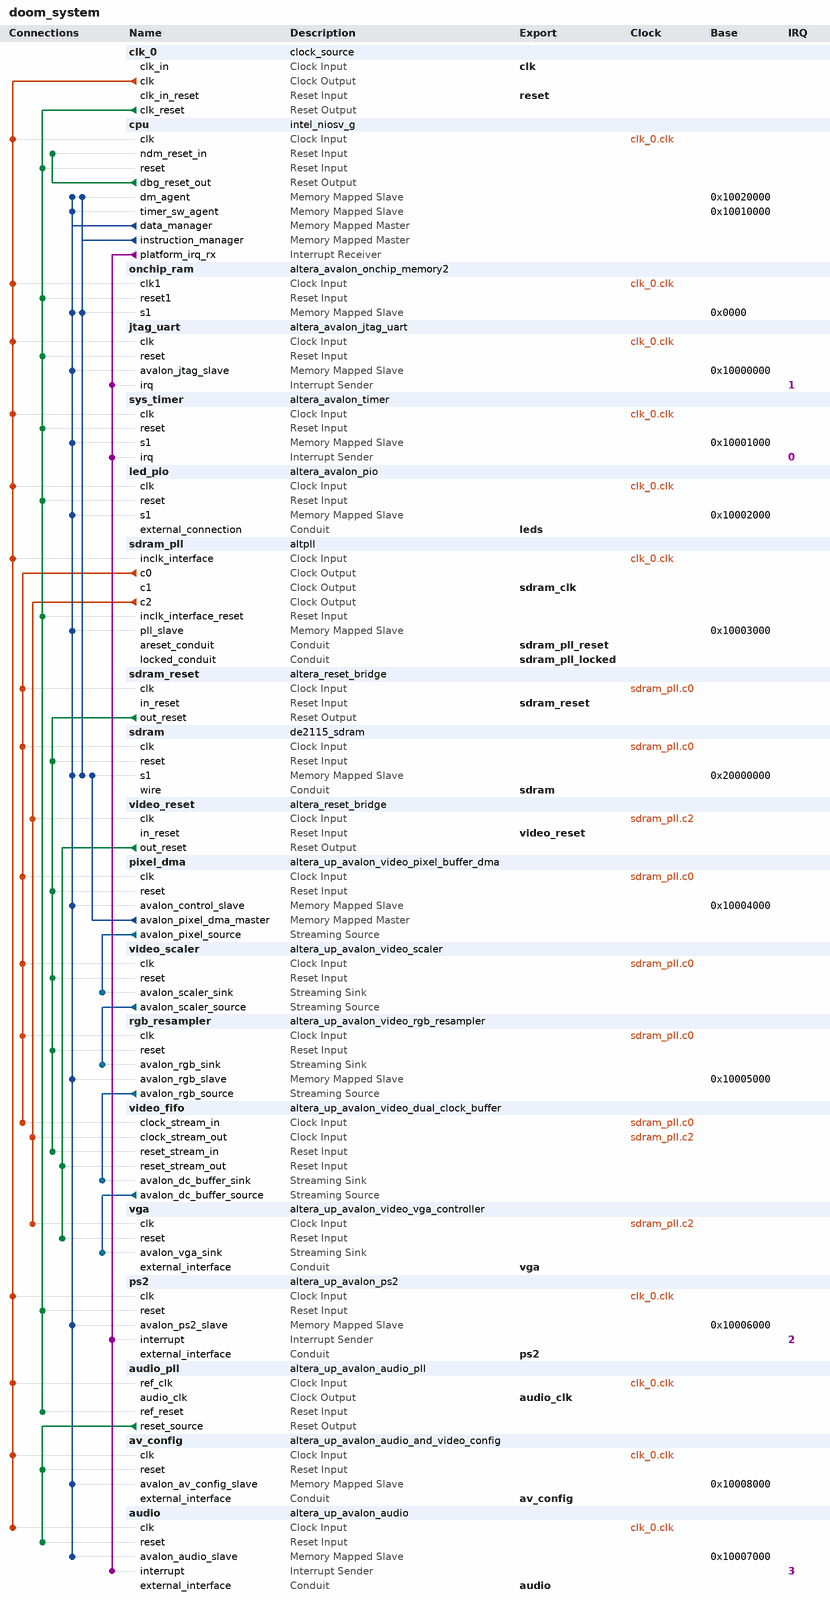
[diagram p0: system contents]
# Platform Designer (Qsys) system doom_system, Cyclone IV E EP4CE115F29C7
# Parameters at their usual value, and those the tool derives, are not listed.
package require -exact qsys 18.0
create_system doom_system
set_project_property DEVICE_FAMILY {Cyclone IV E}
set_project_property DEVICE EP4CE115F29C7

add_instance clk_0 clock_source 25.1
set_instance_parameter_value clk_0 clockFrequency 50000000

add_instance cpu intel_niosv_g 4.0.0
set_instance_parameter_value cpu Blind_Window_Period 1000
set_instance_parameter_value cpu CLICenabledInterruptMode 0
set_instance_parameter_value cpu CLICenabledShadowRegisterFiles 1
set_instance_parameter_value cpu Default_Timeout_Period 255
set_instance_parameter_value cpu alignCLICVectorTable 8
set_instance_parameter_value cpu basicInterruptMode 0
set_instance_parameter_value cpu basicShadowRegisterFiles 0
set_instance_parameter_value cpu clockFrequency 50000000
set_instance_parameter_value cpu dataCacheSize 16384
set_instance_parameter_value cpu disableFsqrtFdiv false
set_instance_parameter_value cpu dtcm1Base 0
set_instance_parameter_value cpu dtcm1Size 0
set_instance_parameter_value cpu dtcm2Base 0
set_instance_parameter_value cpu dtcm2Size 0
set_instance_parameter_value cpu enableBranchPrediction true
set_instance_parameter_value cpu enableCLICInterruptEdgeTriggerConfig false
set_instance_parameter_value cpu enableCLICInterruptPolarityConfig false
set_instance_parameter_value cpu enableCLICSelectiveHardwareVectoring false
set_instance_parameter_value cpu enableCoreLevelInterruptController false
set_instance_parameter_value cpu enableDebug true
set_instance_parameter_value cpu enableDebugReset true
set_instance_parameter_value cpu enableECCFull false
set_instance_parameter_value cpu enableECCLite false
set_instance_parameter_value cpu enableFPU false
set_instance_parameter_value cpu enableLockstep false
set_instance_parameter_value cpu enableLockstepExtRst false
set_instance_parameter_value cpu enableMulDiv true
set_instance_parameter_value cpu hartId 0
set_instance_parameter_value cpu instCacheSize 16384
set_instance_parameter_value cpu itcm1Base 0
set_instance_parameter_value cpu itcm1Size 0
set_instance_parameter_value cpu itcm2Base 0
set_instance_parameter_value cpu itcm2Size 0
set_instance_parameter_value cpu numCLICDebugTriggers 0
set_instance_parameter_value cpu numCLICLevels 2
set_instance_parameter_value cpu numCLICPlatformInterrupts 16
set_instance_parameter_value cpu numCLICPriorities 8
set_instance_parameter_value cpu peripheralRegionABase 268435456
set_instance_parameter_value cpu peripheralRegionASize 1048576
set_instance_parameter_value cpu peripheralRegionBBase 670040064
set_instance_parameter_value cpu peripheralRegionBSize 1048576
set_instance_parameter_value cpu resetOffset 0
set_instance_parameter_value cpu resetSlave onchip_ram.s1
set_instance_parameter_value cpu useResetReq false

add_instance onchip_ram altera_avalon_onchip_memory2 25.1
set_instance_parameter_value onchip_ram blockType M9K
set_instance_parameter_value onchip_ram dataWidth 32
set_instance_parameter_value onchip_ram dualPort false
set_instance_parameter_value onchip_ram initMemContent false
set_instance_parameter_value onchip_ram initializationFileName onchip_mem.hex
set_instance_parameter_value onchip_ram memorySize 65536

add_instance jtag_uart altera_avalon_jtag_uart 25.1
set_instance_parameter_value jtag_uart simInteractiveOptions NO_INTERACTIVE_WINDOWS

add_instance sys_timer altera_avalon_timer 25.1
set_instance_parameter_value sys_timer alwaysRun true
set_instance_parameter_value sys_timer fixedPeriod true
set_instance_parameter_value sys_timer period 1
set_instance_parameter_value sys_timer periodUnits MSEC

add_instance led_pio altera_avalon_pio 25.1
set_instance_parameter_value led_pio direction Output
set_instance_parameter_value led_pio width 8

add_instance sdram_pll altpll 25.1
set_instance_parameter_value sdram_pll CLK0_DIVIDE_BY 1
set_instance_parameter_value sdram_pll CLK0_MULTIPLY_BY 2
set_instance_parameter_value sdram_pll CLK1_DIVIDE_BY 1
set_instance_parameter_value sdram_pll CLK1_DUTY_CYCLE 50
set_instance_parameter_value sdram_pll CLK1_MULTIPLY_BY 2
set_instance_parameter_value sdram_pll CLK1_PHASE_SHIFT -1810
set_instance_parameter_value sdram_pll CLK2_DIVIDE_BY 2
set_instance_parameter_value sdram_pll CLK2_DUTY_CYCLE 50
set_instance_parameter_value sdram_pll CLK2_MULTIPLY_BY 1
set_instance_parameter_value sdram_pll CLK2_PHASE_SHIFT 0
set_instance_parameter_value sdram_pll INCLK0_INPUT_FREQUENCY 20000
set_instance_parameter_value sdram_pll PORT_ARESET PORT_USED
set_instance_parameter_value sdram_pll PORT_LOCKED PORT_USED
set_instance_parameter_value sdram_pll PORT_clk1 PORT_USED
set_instance_parameter_value sdram_pll PORT_clk2 PORT_USED
set_instance_parameter_value sdram_pll PORT_clk3 PORT_UNUSED

add_instance sdram_reset altera_reset_bridge 25.1
set_instance_parameter_value sdram_reset ACTIVE_LOW_RESET 1
set_instance_parameter_value sdram_reset SYNCHRONOUS_EDGES deassert

add_instance sdram de2115_sdram 1.0

add_instance video_reset altera_reset_bridge 25.1
set_instance_parameter_value video_reset ACTIVE_LOW_RESET 1
set_instance_parameter_value video_reset SYNCHRONOUS_EDGES deassert

add_instance pixel_dma altera_up_avalon_video_pixel_buffer_dma 18.0
set_instance_parameter_value pixel_dma addr_mode Consecutive
set_instance_parameter_value pixel_dma back_start_address 670302208
set_instance_parameter_value pixel_dma color_space {16-bit RGB}
set_instance_parameter_value pixel_dma image_height 240
set_instance_parameter_value pixel_dma image_width 320
set_instance_parameter_value pixel_dma start_address 670040064

add_instance video_scaler altera_up_avalon_video_scaler 18.0
set_instance_parameter_value video_scaler color_bits 16
set_instance_parameter_value video_scaler color_planes 1
set_instance_parameter_value video_scaler height_scaling 2
set_instance_parameter_value video_scaler width_in 320
set_instance_parameter_value video_scaler width_scaling 2

add_instance rgb_resampler altera_up_avalon_video_rgb_resampler 18.0
set_instance_parameter_value rgb_resampler alpha 1023
set_instance_parameter_value rgb_resampler input_type {16-bit RGB}
set_instance_parameter_value rgb_resampler output_type {30-bit RGB}

add_instance video_fifo altera_up_avalon_video_dual_clock_buffer 18.0
set_instance_parameter_value video_fifo color_bits 10

add_instance vga altera_up_avalon_video_vga_controller 18.0
set_instance_parameter_value vga board DE2-115
set_instance_parameter_value vga resolution {VGA 640x480}

add_instance ps2 altera_up_avalon_ps2 18.0

add_instance audio_pll altera_up_avalon_audio_pll 18.0
set_instance_parameter_value audio_pll gui_refclk 50.0

add_instance av_config altera_up_avalon_audio_and_video_config 18.0
set_instance_parameter_value av_config audio_in {Line In to ADC}
set_instance_parameter_value av_config bit_length 16
set_instance_parameter_value av_config board DE2-115
set_instance_parameter_value av_config line_in_bypass false
set_instance_parameter_value av_config sampling_rate {48 kHz}

add_instance audio altera_up_avalon_audio 18.0
set_instance_parameter_value audio audio_in false
set_instance_parameter_value audio avalon_bus_type {Memory Mapped}
set_instance_parameter_value audio dw 16

# connections
add_connection clk_0.clk audio.clk clock
add_connection clk_0.clk audio_pll.ref_clk clock
add_connection clk_0.clk av_config.clk clock
add_connection clk_0.clk cpu.clk clock
add_connection clk_0.clk jtag_uart.clk clock
add_connection clk_0.clk led_pio.clk clock
add_connection clk_0.clk onchip_ram.clk1 clock
add_connection clk_0.clk ps2.clk clock
add_connection clk_0.clk sdram_pll.inclk_interface clock
add_connection clk_0.clk sys_timer.clk clock
add_connection sdram_pll.c0 pixel_dma.clk clock
add_connection sdram_pll.c0 rgb_resampler.clk clock
add_connection sdram_pll.c0 sdram.clk clock
add_connection sdram_pll.c0 sdram_reset.clk clock
add_connection sdram_pll.c0 video_fifo.clock_stream_in clock
add_connection sdram_pll.c0 video_scaler.clk clock
add_connection sdram_pll.c2 vga.clk clock
add_connection sdram_pll.c2 video_fifo.clock_stream_out clock
add_connection sdram_pll.c2 video_reset.clk clock
add_connection audio_pll.reset_source audio.reset reset
add_connection audio_pll.reset_source av_config.reset reset
add_connection clk_0.clk_reset audio_pll.ref_reset reset
add_connection clk_0.clk_reset cpu.reset reset
add_connection clk_0.clk_reset jtag_uart.reset reset
add_connection clk_0.clk_reset led_pio.reset reset
add_connection clk_0.clk_reset onchip_ram.reset1 reset
add_connection clk_0.clk_reset ps2.reset reset
add_connection clk_0.clk_reset sdram_pll.inclk_interface_reset reset
add_connection clk_0.clk_reset sys_timer.reset reset
add_connection cpu.dbg_reset_out cpu.ndm_reset_in reset
add_connection sdram_reset.out_reset pixel_dma.reset reset
add_connection sdram_reset.out_reset rgb_resampler.reset reset
add_connection sdram_reset.out_reset sdram.reset reset
add_connection sdram_reset.out_reset video_fifo.reset_stream_in reset
add_connection sdram_reset.out_reset video_scaler.reset reset
add_connection video_reset.out_reset vga.reset reset
add_connection video_reset.out_reset video_fifo.reset_stream_out reset
add_connection cpu.data_manager audio.avalon_audio_slave avalon
set_connection_parameter_value cpu.data_manager/audio.avalon_audio_slave baseAddress 0x10007000
add_connection cpu.data_manager av_config.avalon_av_config_slave avalon
set_connection_parameter_value cpu.data_manager/av_config.avalon_av_config_slave baseAddress 0x10008000
add_connection cpu.data_manager cpu.dm_agent avalon
set_connection_parameter_value cpu.data_manager/cpu.dm_agent baseAddress 0x10020000
add_connection cpu.data_manager cpu.timer_sw_agent avalon
set_connection_parameter_value cpu.data_manager/cpu.timer_sw_agent baseAddress 0x10010000
add_connection cpu.data_manager jtag_uart.avalon_jtag_slave avalon
set_connection_parameter_value cpu.data_manager/jtag_uart.avalon_jtag_slave baseAddress 0x10000000
add_connection cpu.data_manager led_pio.s1 avalon
set_connection_parameter_value cpu.data_manager/led_pio.s1 baseAddress 0x10002000
add_connection cpu.data_manager onchip_ram.s1 avalon
set_connection_parameter_value cpu.data_manager/onchip_ram.s1 baseAddress 0x0000
add_connection cpu.data_manager pixel_dma.avalon_control_slave avalon
set_connection_parameter_value cpu.data_manager/pixel_dma.avalon_control_slave baseAddress 0x10004000
add_connection cpu.data_manager ps2.avalon_ps2_slave avalon
set_connection_parameter_value cpu.data_manager/ps2.avalon_ps2_slave baseAddress 0x10006000
add_connection cpu.data_manager rgb_resampler.avalon_rgb_slave avalon
set_connection_parameter_value cpu.data_manager/rgb_resampler.avalon_rgb_slave baseAddress 0x10005000
add_connection cpu.data_manager sdram.s1 avalon
set_connection_parameter_value cpu.data_manager/sdram.s1 baseAddress 0x20000000
add_connection cpu.data_manager sdram_pll.pll_slave avalon
set_connection_parameter_value cpu.data_manager/sdram_pll.pll_slave baseAddress 0x10003000
add_connection cpu.data_manager sys_timer.s1 avalon
set_connection_parameter_value cpu.data_manager/sys_timer.s1 baseAddress 0x10001000
add_connection cpu.instruction_manager cpu.dm_agent avalon
set_connection_parameter_value cpu.instruction_manager/cpu.dm_agent baseAddress 0x10020000
add_connection cpu.instruction_manager onchip_ram.s1 avalon
set_connection_parameter_value cpu.instruction_manager/onchip_ram.s1 baseAddress 0x0000
add_connection cpu.instruction_manager sdram.s1 avalon
set_connection_parameter_value cpu.instruction_manager/sdram.s1 baseAddress 0x20000000
add_connection pixel_dma.avalon_pixel_dma_master sdram.s1 avalon
set_connection_parameter_value pixel_dma.avalon_pixel_dma_master/sdram.s1 baseAddress 0x20000000
add_connection pixel_dma.avalon_pixel_source video_scaler.avalon_scaler_sink avalon_streaming
add_connection rgb_resampler.avalon_rgb_source video_fifo.avalon_dc_buffer_sink avalon_streaming
add_connection video_fifo.avalon_dc_buffer_source vga.avalon_vga_sink avalon_streaming
add_connection video_scaler.avalon_scaler_source rgb_resampler.avalon_rgb_sink avalon_streaming
add_connection cpu.platform_irq_rx audio.interrupt interrupt
set_connection_parameter_value cpu.platform_irq_rx/audio.interrupt irqNumber 3
add_connection cpu.platform_irq_rx jtag_uart.irq interrupt
set_connection_parameter_value cpu.platform_irq_rx/jtag_uart.irq irqNumber 1
add_connection cpu.platform_irq_rx ps2.interrupt interrupt
set_connection_parameter_value cpu.platform_irq_rx/ps2.interrupt irqNumber 2
add_connection cpu.platform_irq_rx sys_timer.irq interrupt
set_connection_parameter_value cpu.platform_irq_rx/sys_timer.irq irqNumber 0

# exported interfaces
add_interface audio conduit end
set_interface_property audio EXPORT_OF audio.external_interface
add_interface audio_clk clock source
set_interface_property audio_clk EXPORT_OF audio_pll.audio_clk
add_interface av_config conduit end
set_interface_property av_config EXPORT_OF av_config.external_interface
add_interface clk clock sink
set_interface_property clk EXPORT_OF clk_0.clk_in
add_interface leds conduit end
set_interface_property leds EXPORT_OF led_pio.external_connection
add_interface ps2 conduit end
set_interface_property ps2 EXPORT_OF ps2.external_interface
add_interface reset reset sink
set_interface_property reset EXPORT_OF clk_0.clk_in_reset
add_interface sdram conduit end
set_interface_property sdram EXPORT_OF sdram.wire
add_interface sdram_clk clock source
set_interface_property sdram_clk EXPORT_OF sdram_pll.c1
add_interface sdram_pll_locked conduit end
set_interface_property sdram_pll_locked EXPORT_OF sdram_pll.locked_conduit
add_interface sdram_pll_reset conduit end
set_interface_property sdram_pll_reset EXPORT_OF sdram_pll.areset_conduit
add_interface sdram_reset reset sink
set_interface_property sdram_reset EXPORT_OF sdram_reset.in_reset
add_interface vga conduit end
set_interface_property vga EXPORT_OF vga.external_interface
add_interface video_reset reset sink
set_interface_property video_reset EXPORT_OF video_reset.in_reset

set_interconnect_requirement {$system} qsys_mm.clockCrossingAdapter HANDSHAKE
set_interconnect_requirement {$system} qsys_mm.enableEccProtection FALSE
set_interconnect_requirement {$system} qsys_mm.insertDefaultSlave FALSE
set_interconnect_requirement {$system} qsys_mm.maxAdditionalLatency 1

save_system doom_system.qsys
